# Altium project Mother-daughter.PrjPcb
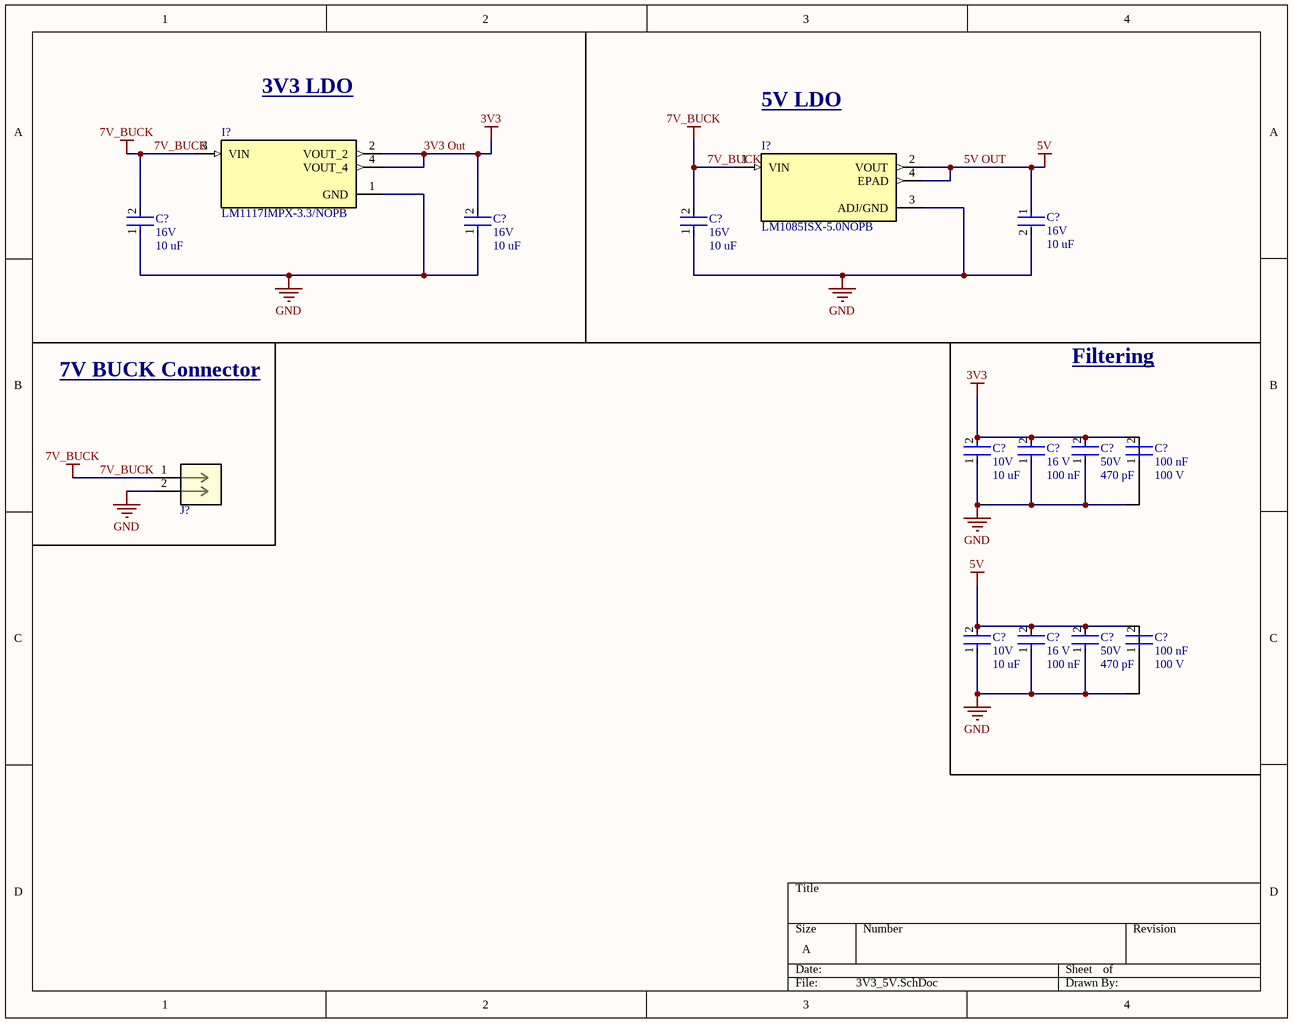
[diagram p0: 3V3_5V.SchDoc]
4 sheets, 69 parts. Net scope: flat (ports and power ports of the same name join across sheets).
Sheets:
  3V3_5V.SchDoc
  CAN.SchDoc
  Connectors.SchDoc
  MCU.SchDoc

## Sheet 3V3_5V.SchDoc
size A; SheetNumber: 1; SheetTotal: 4

### Parts
(Parts that share a designator on the sheet are numbered #1, #2 ... from top to bottom, then left to right.)
C?#1  Voltage: 16V  Capacitance: 10 uF  [CAP-1206]  (hidden comment: 293D106X9016A2TE3)
C?#2  Voltage: 16V  Capacitance: 10 uF  [CAP-1206]  (hidden comment: 293D106X9016A2TE3)
C?#3  Voltage: 16V  Capacitance: 10 uF  [CAP-1206]  (hidden comment: 293D106X9016A2TE3)
C?#4  Voltage: 16V  Capacitance: 10 uF  [CAP-1206]  (hidden comment: 293D106X9016A2TE3)
C?#5  Voltage: 10V  Capacitance: 10 uF  [CAP-0603]  (hidden comment: CC0603KRX5R6BB106)
C?#6  Voltage Rating: 16 V  Capacitance: 100 nF  [CAP-0402]  (hidden comment: CC0402KRX7R7BB104)
C?#7  Voltage: 50V  Capacitance: 470 pF  [CAP-0805]  (hidden comment: CC0805JRNPO9BN471)
C?#8  Capacitance: 100 nF  Voltage: 100 V  [CAP-0603]  (hidden comment: CC0603KRX7R0BB104)
C?#9  Voltage: 10V  Capacitance: 10 uF  [CAP-0603]  (hidden comment: CC0603KRX5R6BB106)
C?#10  Voltage Rating: 16 V  Capacitance: 100 nF  [CAP-0402]  (hidden comment: CC0402KRX7R7BB104)
C?#11  Voltage: 50V  Capacitance: 470 pF  [CAP-0805]  (hidden comment: CC0805JRNPO9BN471)
C?#12  Capacitance: 100 nF  Voltage: 100 V  [CAP-0603]  (hidden comment: CC0603KRX7R0BB104)
I?#1  LM1117IMPX-3.3/NOPB  [IC-SOT-223-4]
I?#2  LM1085ISX-5.0NOPB  [IC-TO-263-4]
J?#1  0430450212  [CON_430450212_MOL]  (value not drawn)

### Nets
3V3 Out: C?#3.2 C?#5.2 C?#6.2 C?#7.2 I?#1.2(VOUT_2) I?#1.4(VOUT_4)  [also labelled 3V3]
5V OUT: C?#1.1 C?#9.2 C?#10.2 C?#11.2 I?#2.2(VOUT) I?#2.4(EPAD)  [also labelled 5V]
7V_BUCK: C?#2.2 C?#4.2 I?#1.3(VIN) I?#2.1(VIN) J?#1.1
GND: C?#1.2 C?#2.1 C?#3.1 C?#4.1 C?#5.1 C?#6.1 C?#7.1 C?#9.1 C?#10.1 C?#11.1 I?#1.1(GND) I?#2.3(ADJ/GND) J?#1.2

Not connected (* = marked no-connect by the designer): C?#8 1 2; C?#12 1 2

### Notes on the sheet
- 3V3 LDO
- 5V LDO
- Filtering
- 7V BUCK Connector

### Library data of the parts
C?#1-C?#4 = CAP-10U-0004: CAP TANT 10UF 10% 16V 1206; Device Class: Tantalum; Size: 1206; ComponentLink1Description: Datasheet; ComponentLink1URL: https://www.lcsc.com/datasheet/lcsc_datasheet_2304140030_Vishay-Intertech-293D106X9016A2TE3_C110038.pdf
C?#5 C?#9 = CAP-10U-0001: CAP CER 10UF 10V X5R 0603; ComponentLink1Description: Datasheet; ComponentLink1URL: https://www.yageo.com/upload/media/product/app/datasheet/mlcc/upy-gphc_x5r_4v-to-50v.pdf; Device Class: Ceramic; Size: 0603
C?#6 C?#10 = CAP-0.1U-0001: CAP CER 0.1UF 16V X7R 0402; ComponentLink2Description: Datasheet; ComponentLink2URL: https://www.yageo.com/upload/media/product/productsearch/datasheet/mlcc/UPY-GPHC_X7R_6.3V-to-250V_24.pdf; Device Class: Ceramic; Size: 0402
C?#7 C?#11 = CAP-470P-0001: CAP CER 470PF 50V C0G/NPO 0805; Device Class: Ceramic; Size: 0805; ComponentLink1Description: Datasheet; ComponentLink1URL: https://www.yageo.com/upload/media/product/productsearch/datasheet/mlcc/UPY-GP_NP0_16V-to-50V_18.pdf
C?#8 C?#12 = CAP-100N-0001: CAP CER 0.1UF 100V X7R 0603; Device Class: Ceramic; Size: 0603; ComponentLink1Description: Datasheet; ComponentLink1URL: https://www.yageo.com/upload/media/product/app/datasheet/mlcc/upy-np0x7r_mv_100-to-630v.pdf
I?#1 = IC_LDO_3V3_0001: IC REG LIN 3.3V 800MA SOT223-4; ComponentLink1Description: New link; ComponentLink1URL: https://www.ti.com/lit/ds/symlink/lm1117.pdf?HQS=dis-dk-null-digikeymode-dsf-pf-null-wwe&ts=1721700739746
I?#2 = IC_LDO_5V_0002: IC REG LIN 5V 3A DDPAK/TO263-3; Mfr_Name: Texas Instruments; RefDes: RefDes; Type: Type; ComponentLink1Description: Datasheet; ComponentLink1URL: https://www.ti.com/lit/ds/symlink/lm1085.pdf?HQS=dis-dk-null-digikeymode-dsf-pf-null-wwe&ts=1729859809163&ref_url=https%253A%252F%252Fwww.ti.com%252Fgeneral%252Fdocs%252Fsuppproductinfo.tsp%253FdistId%253D10%2526gotoUrl%253Dhttps%253A%252F%252Fwww.ti.com%252Flit%252Fgpn%252Flm1085
J?#1 = CONN-2POS-0001: Connector Header Through Hole 2 position; Mfr_Name: Molex Connector Corporation; RefDes: RefDes; Type: Type

## Sheet CAN.SchDoc
size A; SheetNumber: 2; SheetTotal: 4
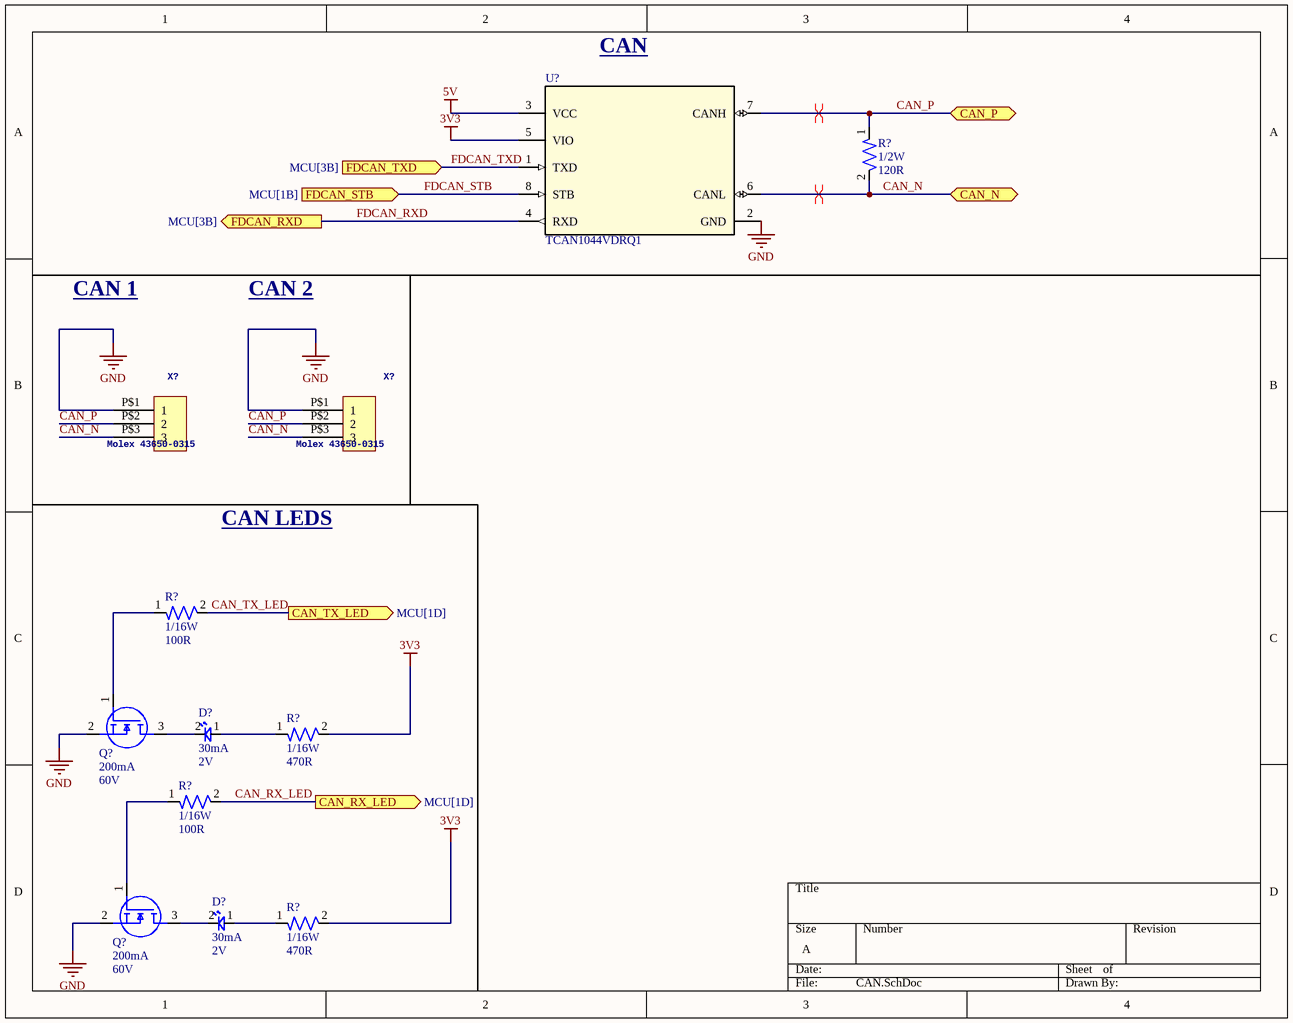
[diagram p1: CAN.SchDoc]

### Parts
(Parts that share a designator on the sheet are numbered #1, #2 ... from top to bottom, then left to right.)
D?#1  Forward Current: 30mA  Forward Voltage: 2V  [LED-0603]  (hidden comment: BL-HKC36G-AV-TRB)
D?#2  Forward Current: 30mA  Forward Voltage: 2V  [LED-0603]  (hidden comment: BL-HKC36G-AV-TRB)
Q?#1  Continuous Current: 200mA  Voltage: 60V  [IC-SOT23-3]  (hidden comment: T2N7002AK,LM)
Q?#2  Continuous Current: 200mA  Voltage: 60V  [IC-SOT23-3]  (hidden comment: T2N7002AK,LM)
R?#1  Power: 1/2W  Resistance: 120R  [RES-1210]  (hidden comment: RC1210FR-07120RL)
R?#2  Power: 1/16W  Resistance: 100R  [RES-0402]  (hidden comment: RC0402FR-07100RL)
R?#3  Power: 1/16W  Resistance: 470R  [RES-0402]  (hidden comment: RC0402FR-07470RL)
R?#4  Power: 1/16W  Resistance: 100R  [RES-0402]  (hidden comment: RC0402FR-07100RL)
R?#5  Power: 1/16W  Resistance: 470R  [RES-0402]  (hidden comment: RC0402FR-07470RL)
U?#1  TCAN1044VDRQ1  [IC-8SOIC]
X?#1  Molex 43650-0315  [43650-0315]
X?#2  Molex 43650-0315  [43650-0315]

### Ports
CAN_N (bidir), CAN_P (bidir), CAN_RX_LED (out, see MCU[1D]), CAN_TX_LED (out, see MCU[1D]), FDCAN_RXD (out, see MCU[3B]), FDCAN_STB (in, see MCU[1B]), FDCAN_TXD (in, see MCU[3B])

### Nets
3V3: R?#3.2 R?#5.2 U?#1.5(VIO)  [project net 3V3 Out]
5V: U?#1.3(VCC)  [project net 5V OUT]
GND: Q?#1.2(S) Q?#2.2(S) U?#1.2(GND) X?#1.P$1(1) X?#2.P$1(1)
CAN_N: R?#1.2 U?#1.6(CANL) X?#1.P$3(3) X?#2.P$3(3) ; port CAN_N
CAN_P: R?#1.1 U?#1.7(CANH) X?#1.P$2(2) X?#2.P$2(2) ; port CAN_P
CAN_RX_LED: R?#4.2 ; port CAN_RX_LED
CAN_TX_LED: R?#2.2 ; port CAN_TX_LED
FDCAN_RXD: U?#1.4(RXD) ; port FDCAN_RXD
FDCAN_STB: U?#1.8(STB) ; port FDCAN_STB
FDCAN_TXD: U?#1.1(TXD) ; port FDCAN_TXD
NetD?#1_1: D?#1.1 R?#3.1
NetD?#1_2: D?#1.2 Q?#1.3(D)
NetD?#2_1: D?#2.1 R?#5.1
NetD?#2_2: D?#2.2 Q?#2.3(D)
NetQ?#1_1: Q?#1.1(G) R?#2.1
NetQ?#2_1: Q?#2.1(G) R?#4.1

### Layout directives
differential pair: CAN_N, CAN_P

### Notes on the sheet
- CAN
- CAN 1
- CAN 2
- CAN LEDS

### Library data of the parts
D?#1 D?#2 = LED-0001: LED YELLOW CLEAR 0603 SMD; ComponentLink1Description: Datasheet; ComponentLink1URL: https://www.americanbrightled.com/pdffiles/led-components/smt/BL-HKC36G-AV-TRB.pdf
Q?#1 Q?#2 = NMOS-200MA-0001: MOSFET N-CH 60V 200MA SOT23; ComponentLink1Description: Datasheet; ComponentLink1URL: https://toshiba.semicon-storage.com/info/T2N7002AK_datasheet_en_20150401.pdf?did=29712&prodName=T2N7002AK
R?#1 = RES-120-0001: RES 120 OHM 1% 1/2W 1210; Tolerance: 1%; Size: 1210; ComponentLink1Description: Datasheet; ComponentLink1URL: https://www.yageo.com/upload/media/product/products/datasheet/rchip/PYu-RC_Group_51_RoHS_L_12.pdf
R?#2 R?#4 = RES-100-0001: RES 100 OHM 1% 1/16W 0402; Tolerance: 1%; Size: 0402; ComponentLink1Description: Datasheet; ComponentLink1URL: https://www.yageo.com/upload/media/product/products/datasheet/rchip/PYu-RC_Group_51_RoHS_L_12.pdf
R?#3 R?#5 = RES-470-0001: RES 470 OHM 1% 1/16W 0402; Tolerance: 1%; Size: 0402; ComponentLink1Description: Datasheet; ComponentLink1URL: https://www.yageo.com/upload/media/product/products/datasheet/rchip/PYu-RC_Group_51_RoHS_L_12.pdf
U?#1 = IC-CAN-0001: IC TRANSCEIVER 1/1 8SOIC; ComponentLink1Description: Datasheet; ComponentLink1URL: https://www.ti.com/lit/ds/symlink/tcan1044-q1.pdf?HQS=dis-dk-null-digikeymode-dsf-pf-null-wwe&ts=1728758303289&ref_url=https%253A%252F%252Fwww.ti.com%252Fgeneral%252Fdocs%252Fsuppproductinfo.tsp%253FdistId%253D10%2526gotoUrl%253Dhttps%253A%252F%252Fwww.ti.com%252Flit%252Fgpn%252Ftcan1044-q1
X?#1 X?#2 = Micro-Fit Molex 3 Pin Vertical: GateName_1: G$1; SymbolName_1: HEADER_POS3; DeviceSetName: HEADER_POS3_?; DeviceName: 43650-0315; LibraryName: con-molex-micro-fit-3_0_2; Package: 43650-0315

## Sheet Connectors.SchDoc
size A; SheetNumber: 3; SheetTotal: 4
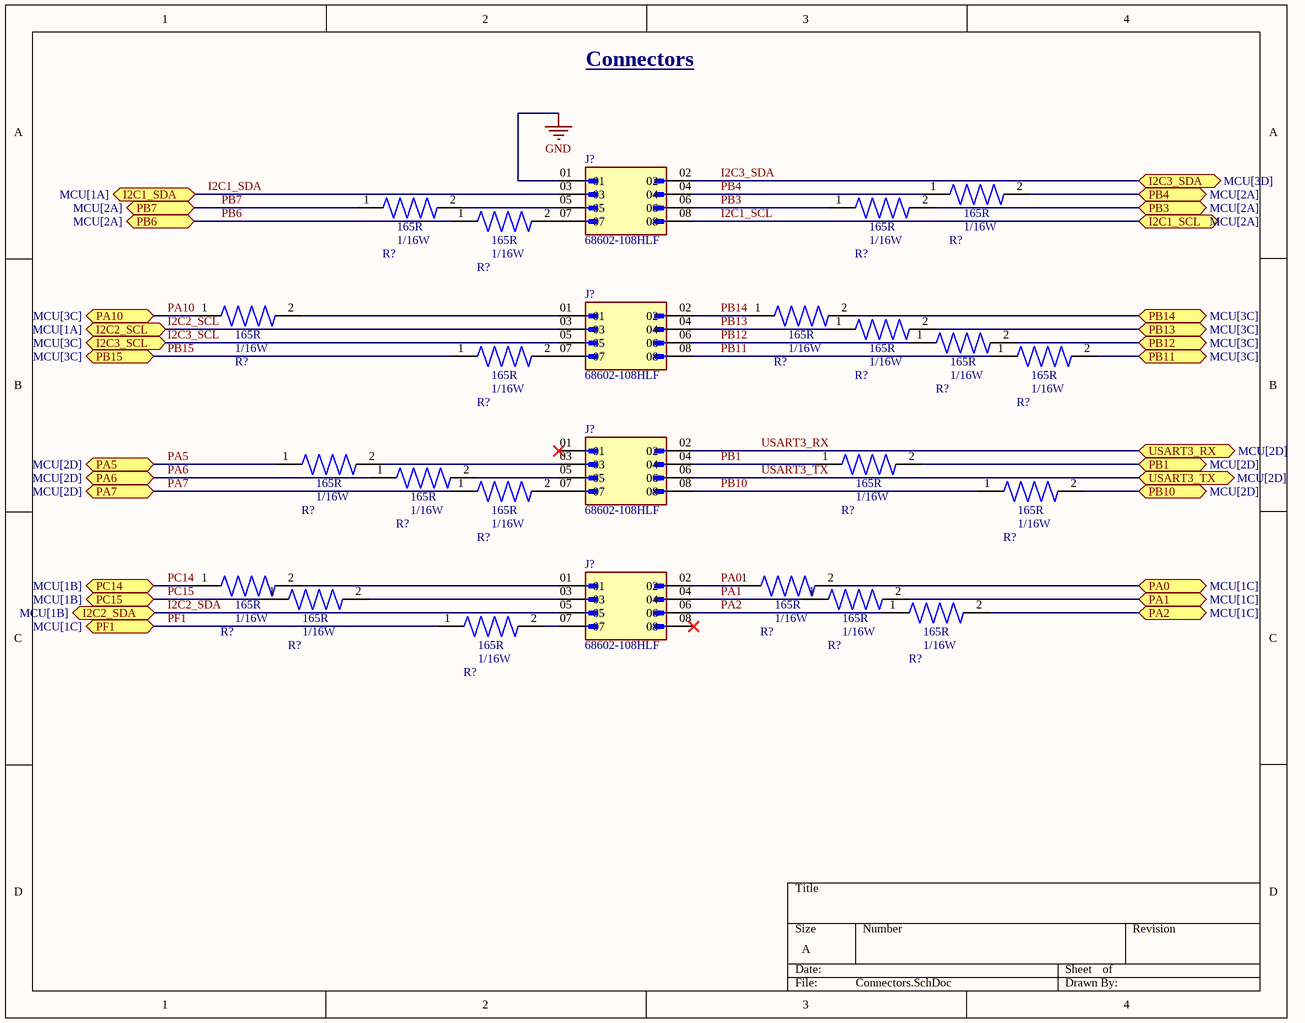
[diagram p2: Connectors.SchDoc]

### Parts
(Parts that share a designator on the sheet are numbered #1, #2 ... from top to bottom, then left to right.)
J?#2  68602-108HLF  [AMPHENOL_68602-108HLF]
J?#3  68602-108HLF  [AMPHENOL_68602-108HLF]
J?#4  68602-108HLF  [AMPHENOL_68602-108HLF]
J?#5  68602-108HLF  [AMPHENOL_68602-108HLF]
R?#6  RC0402FR-07165RL  [RESC1005X40N]  (value not drawn)
R?#7  RC0402FR-07165RL  [RESC1005X40N]  (value not drawn)
R?#8  RC0402FR-07165RL  [RESC1005X40N]  (value not drawn)
R?#9  RC0402FR-07165RL  [RESC1005X40N]  (value not drawn)
R?#10  RC0402FR-07165RL  [RESC1005X40N]  (value not drawn)
R?#11  RC0402FR-07165RL  [RESC1005X40N]  (value not drawn)
R?#12  RC0402FR-07165RL  [RESC1005X40N]  (value not drawn)
R?#13  RC0402FR-07165RL  [RESC1005X40N]  (value not drawn)
R?#14  RC0402FR-07165RL  [RESC1005X40N]  (value not drawn)
R?#15  RC0402FR-07165RL  [RESC1005X40N]  (value not drawn)
R?#16  RC0402FR-07165RL  [RESC1005X40N]  (value not drawn)
R?#17  RC0402FR-07165RL  [RESC1005X40N]  (value not drawn)
R?#18  RC0402FR-07165RL  [RESC1005X40N]  (value not drawn)
R?#19  RC0402FR-07165RL  [RESC1005X40N]  (value not drawn)
R?#20  RC0402FR-07165RL  [RESC1005X40N]  (value not drawn)
R?#21  RC0402FR-07165RL  [RESC1005X40N]  (value not drawn)
R?#22  RC0402FR-07165RL  [RESC1005X40N]  (value not drawn)
R?#23  RC0402FR-07165RL  [RESC1005X40N]  (value not drawn)
R?#24  RC0402FR-07165RL  [RESC1005X40N]  (value not drawn)
R?#25  RC0402FR-07165RL  [RESC1005X40N]  (value not drawn)
R?#26  RC0402FR-07165RL  [RESC1005X40N]  (value not drawn)

### Ports
I2C1_SCL (bidir, see MCU[2A]), I2C1_SDA (bidir, see MCU[1A]), I2C2_SCL (bidir, see MCU[1A]), I2C2_SDA (bidir, see MCU[1B]), I2C3_SCL (bidir, see MCU[3C]), I2C3_SDA (bidir, see MCU[3D]), PA0 (bidir, see MCU[1C]), PA1 (bidir, see MCU[1C]), PA2 (bidir, see MCU[1C]), PA5 (bidir, see MCU[2D]), PA6 (bidir, see MCU[2D]), PA7 (bidir, see MCU[2D]), PA10 (bidir, see MCU[3C]), PB1 (bidir, see MCU[2D]), PB3 (bidir, see MCU[2A]), PB4 (bidir, see MCU[2A]), PB6 (bidir, see MCU[2A]), PB7 (bidir, see MCU[2A]), PB10 (bidir, see MCU[2D]), PB11 (bidir, see MCU[3C]), PB12 (bidir, see MCU[3C]), PB13 (bidir, see MCU[3C]), PB14 (bidir, see MCU[3C]), PB15 (bidir, see MCU[3C]), PC14 (bidir, see MCU[1B]), PC15 (bidir, see MCU[1B]), PF1 (bidir, see MCU[1C]), USART3_RX (bidir, see MCU[2D]), USART3_TX (bidir, see MCU[2D])

### Nets
GND: J?#2.01
I2C1_SCL: J?#2.08 ; port I2C1_SCL
I2C1_SDA: J?#2.03 ; port I2C1_SDA
I2C2_SCL: J?#3.03 ; port I2C2_SCL
I2C2_SDA: J?#5.05 ; port I2C2_SDA
I2C3_SCL: J?#3.05 ; port I2C3_SCL
I2C3_SDA: J?#2.02 ; port I2C3_SDA
PA0: J?#5.02 R?#22.1
PA0: R?#22.2 ; port PA0  [a separate net that carries the same name]
PA1: J?#5.04 R?#24.1
PA1: R?#24.2 ; port PA1  [a separate net that carries the same name]
PA2: J?#5.06 R?#25.1
PA2: R?#25.2 ; port PA2  [a separate net that carries the same name]
PA5: R?#16.1 ; port PA5
PA6: R?#18.1 ; port PA6
PA7: R?#19.1 ; port PA7
PA10: R?#10.1 ; port PA10
PB1: J?#4.04 R?#17.1
PB1: R?#17.2 ; port PB1  [a separate net that carries the same name]
PB3: J?#2.06 R?#8.1
PB3: R?#8.2 ; port PB3  [a separate net that carries the same name]
PB4: J?#2.04 R?#6.1
PB4: R?#6.2 ; port PB4  [a separate net that carries the same name]
PB6: R?#9.1 ; port PB6
PB7: R?#7.1 ; port PB7
PB10: J?#4.08 R?#20.1
PB10: R?#20.2 ; port PB10  [a separate net that carries the same name]
PB11: J?#3.08 R?#15.1
PB11: R?#15.2 ; port PB11  [a separate net that carries the same name]
PB12: J?#3.06 R?#13.1
PB12: R?#13.2 ; port PB12  [a separate net that carries the same name]
PB13: J?#3.04 R?#12.1
PB13: R?#12.2 ; port PB13  [a separate net that carries the same name]
PB14: J?#3.02 R?#11.1
PB14: R?#11.2 ; port PB14  [a separate net that carries the same name]
PB15: R?#14.1 ; port PB15
PC14: R?#21.1 ; port PC14
PC15: R?#23.1 ; port PC15
PF1: R?#26.1 ; port PF1
USART3_RX: J?#4.02 ; port USART3_RX
USART3_TX: J?#4.06 ; port USART3_TX
NetJ?#2_05: J?#2.05 R?#7.2
NetJ?#2_07: J?#2.07 R?#9.2
NetJ?#3_01: J?#3.01 R?#10.2
NetJ?#3_07: J?#3.07 R?#14.2
NetJ?#4_03: J?#4.03 R?#16.2
NetJ?#4_05: J?#4.05 R?#18.2
NetJ?#4_07: J?#4.07 R?#19.2
NetJ?#5_01: J?#5.01 R?#21.2
NetJ?#5_03: J?#5.03 R?#23.2
NetJ?#5_07: J?#5.07 R?#26.2

Not connected (* = marked no-connect by the designer): J?#4 01*; J?#5 08*

### Notes on the sheet
- Connectors
- (in symbol CAP-100U-0001) +

### Library data of the parts
J?#2-J?#5 = CONN-8POS-0002: CONN HEADER VERT 8POS 2.54MM; MF: Amphenol ICC (FCI); SnapEDA_Link: https://www.snapeda.com/parts/68602-108HLF/Amphenol+FCI/view-part/?ref=snap; Package: None; MP: 68602-108HLF; Check_prices: https://www.snapeda.com/parts/68602-108HLF/Amphenol+FCI/view-part/?ref=eda; Price: None; Value: *; Availability: In Stock
R?#6-R?#26 = RES-165-0001: RES 165 OHM 1% 1/16W 0402; Package: None; Price: None; Value: *; MP: RC0402FR-07165RL; Availability: Unavailable

## Sheet MCU.SchDoc
size A; SheetNumber: 4; SheetTotal: 4
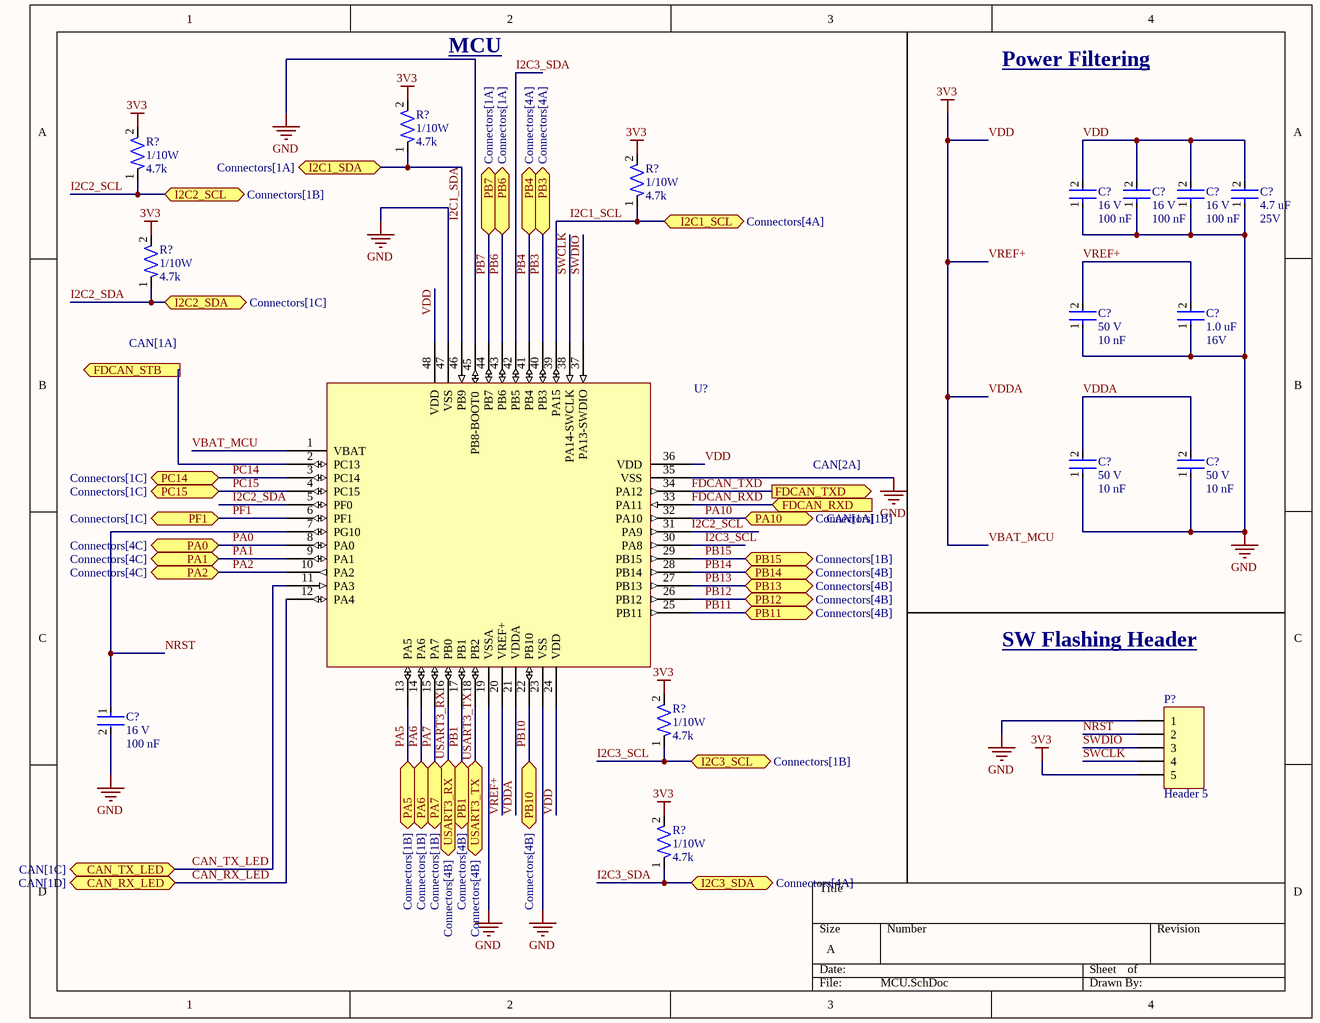
[diagram p3: MCU.SchDoc]

### Parts
(Parts that share a designator on the sheet are numbered #1, #2 ... from top to bottom, then left to right.)
C?#13  Voltage Rating: 16 V  Capacitance: 100 nF  [CAP-0402]  (hidden comment: CC0402KRX7R7BB104)
C?#14  Voltage Rating: 16 V  Capacitance: 100 nF  [CAP-0402]  (hidden comment: CC0402KRX7R7BB104)
C?#15  Voltage Rating: 16 V  Capacitance: 100 nF  [CAP-0402]  (hidden comment: CC0402KRX7R7BB104)
C?#16  Capacitance: 4.7 uF  Voltage: 25V  [CAP-0603]  (hidden comment: CC0603KRX5R8BB475)
C?#17  Voltage: 50 V  Capacitance: 10 nF  [CAP-0603]  (hidden comment: CC0603KPX7R9BB103)
C?#18  Capacitance: 1.0 uF  Voltage: 16V  [CAP-0603]  (hidden comment: CC0603KRX7R7BB105)
C?#19  Voltage: 50 V  Capacitance: 10 nF  [CAP-0603]  (hidden comment: CC0603KPX7R9BB103)
C?#20  Voltage: 50 V  Capacitance: 10 nF  [CAP-0603]  (hidden comment: CC0603KPX7R9BB103)
C?#21  Voltage Rating: 16 V  Capacitance: 100 nF  [CAP-0402]  (hidden comment: CC0402KRX7R7BB104)
P?  Header 5  [HDR1X5]
R?#27  Power: 1/10W  Resistance: 4.7k  [RES-0603]  (hidden comment: RC0603FR-074K7L)
R?#28  Power: 1/10W  Resistance: 4.7k  [RES-0603]  (hidden comment: RC0603FR-074K7L)
R?#29  Power: 1/10W  Resistance: 4.7k  [RES-0603]  (hidden comment: RC0603FR-074K7L)
R?#30  Power: 1/10W  Resistance: 4.7k  [RES-0603]  (hidden comment: RC0603FR-074K7L)
R?#31  Power: 1/10W  Resistance: 4.7k  [RES-0603]  (hidden comment: RC0603FR-074K7L)
R?#32  Power: 1/10W  Resistance: 4.7k  [RES-0603]  (hidden comment: RC0603FR-074K7L)
U?#2  STM32G431CBT6  [IC-LQFP48]  (value not drawn)

### Ports
CAN_RX_LED (bidir, see CAN[1D]), CAN_TX_LED (bidir, see CAN[1C]), FDCAN_RXD (in, see CAN[1A]), FDCAN_STB (out, see CAN[1A]), FDCAN_TXD (out, see CAN[2A]), I2C1_SCL (bidir, see Connectors[4A]), I2C1_SDA (bidir, see Connectors[1A]), I2C2_SCL (bidir, see Connectors[1B]), I2C2_SDA (bidir, see Connectors[1C]), I2C3_SCL (bidir, see Connectors[1B]), I2C3_SDA (bidir, see Connectors[4A]), PA0 (bidir, see Connectors[4C]), PA1 (bidir, see Connectors[4C]), PA2 (bidir, see Connectors[4C]), PA5 (bidir, see Connectors[1B]), PA6 (bidir, see Connectors[1B]), PA7 (bidir, see Connectors[1B]), PA10 (bidir, see Connectors[1B]), PB1 (bidir, see Connectors[4B]), PB3 (bidir, see Connectors[4A]), PB4 (bidir, see Connectors[4A]), PB6 (bidir, see Connectors[1A]), PB7 (bidir, see Connectors[1A]), PB10 (bidir, see Connectors[4B]), PB11 (bidir, see Connectors[4B]), PB12 (bidir, see Connectors[4B]), PB13 (bidir, see Connectors[4B]), PB14 (bidir, see Connectors[4B]), PB15 (bidir, see Connectors[1B]), PC14 (bidir, see Connectors[1C]), PC15 (bidir, see Connectors[1C]), PF1 (bidir, see Connectors[1C]), USART3_RX (bidir, see Connectors[4B]), USART3_TX (bidir, see Connectors[4B])

### Nets
3V3: C?#13.2 C?#14.2 C?#15.2 C?#16.2 C?#17.2 C?#18.2 C?#19.2 C?#20.2 P?.5 R?#27.2 R?#28.2 R?#29.2 R?#30.2 R?#31.2 R?#32.2 U?#2.1(VBAT) U?#2.20(VREF+) U?#2.21(VDDA) U?#2.24(VDD) U?#2.36(VDD) U?#2.48(VDD)  [also labelled VBAT_MCU, VDD, VDDA, VREF+]  [project net 3V3 Out]
GND: C?#13.1 C?#14.1 C?#15.1 C?#16.1 C?#17.1 C?#18.1 C?#19.1 C?#20.1 C?#21.2 P?.1 U?#2.19(VSSA) U?#2.23(VSS) U?#2.35(VSS) U?#2.45(PB8-BOOT0) U?#2.47(VSS)
CAN_RX_LED: U?#2.12(PA4) ; port CAN_RX_LED
CAN_TX_LED: U?#2.11(PA3) ; port CAN_TX_LED
FDCAN_RXD: U?#2.33(PA11) ; port FDCAN_RXD
FDCAN_STB: U?#2.2(PC13) ; port FDCAN_STB
FDCAN_TXD: U?#2.34(PA12) ; port FDCAN_TXD
I2C1_SCL: R?#29.1 U?#2.39(PA15) ; port I2C1_SCL
I2C1_SDA: R?#27.1 U?#2.46(PB9) ; port I2C1_SDA
I2C2_SCL: R?#28.1 U?#2.31(PA9) ; port I2C2_SCL
I2C2_SDA: R?#30.1 U?#2.5(PF0) ; port I2C2_SDA
I2C3_SCL: R?#31.1 U?#2.30(PA8) ; port I2C3_SCL
I2C3_SDA: R?#32.1 U?#2.42(PB5) ; port I2C3_SDA
NRST: C?#21.1 P?.2 U?#2.7(PG10)
PA0: U?#2.8(PA0) ; port PA0
PA1: U?#2.9(PA1) ; port PA1
PA2: U?#2.10(PA2) ; port PA2
PA5: U?#2.13(PA5) ; port PA5
PA6: U?#2.14(PA6) ; port PA6
PA7: U?#2.15(PA7) ; port PA7
PA10: U?#2.32(PA10) ; port PA10
PB1: U?#2.17(PB1) ; port PB1
PB3: U?#2.40(PB3) ; port PB3
PB4: U?#2.41(PB4) ; port PB4
PB6: U?#2.43(PB6) ; port PB6
PB7: U?#2.44(PB7) ; port PB7
PB10: U?#2.22(PB10) ; port PB10
PB11: U?#2.25(PB11) ; port PB11
PB12: U?#2.26(PB12) ; port PB12
PB13: U?#2.27(PB13) ; port PB13
PB14: U?#2.28(PB14) ; port PB14
PB15: U?#2.29(PB15) ; port PB15
PC14: U?#2.3(PC14) ; port PC14
PC15: U?#2.4(PC15) ; port PC15
PF1: U?#2.6(PF1) ; port PF1
SWCLK: P?.4 U?#2.38(PA14-SWCLK)
SWDIO: P?.3 U?#2.37(PA13-SWDIO)
USART3_RX: U?#2.16(PB0) ; port USART3_RX
USART3_TX: U?#2.18(PB2) ; port USART3_TX

### Notes on the sheet
- MCU
- Power Filtering
- SW Flashing Header

### Library data of the parts
C?#13-C?#15 C?#21 = CAP-0.1U-0001: CAP CER 0.1UF 16V X7R 0402; ComponentLink2Description: Datasheet; ComponentLink2URL: https://www.yageo.com/upload/media/product/productsearch/datasheet/mlcc/UPY-GPHC_X7R_6.3V-to-250V_24.pdf; Device Class: Ceramic; Size: 0402
C?#16 = CAP-4.7U-0001: CAP CER 4.7UF 25V X5R 0603; Device Class: Ceramic; Size: 0603
C?#17 C?#19 C?#20 = CAP-10N-0002: CAP CER 10000PF 50V X7R 0603; ComponentLink2Description: Datasheet; ComponentLink2URL: http://www.yageo.com/documents/recent/UPY-GPHC_X7R_6.3V-to-50V_18.pdf; Device Class: Ceramic; Size: 0603
C?#18 = CAP-1U-0002: CAP CER 1UF 16V X7R 0603; Device Class: Ceramic; Size: 0603
P? = Header 5: Header, 5-Pin; LatestRevisionDate: 17-Jul-2002; LatestRevisionNote: Re-released for DXP Platform.; Publisher: Altium Limited
R?#27-R?#32 = RES-4.7k-0001: RES 4.7K OHM 1% 1/10W 0603; Tolerance: 1%; Size: 0603; ComponentLink1Description: Datasheet; ComponentLink1URL: https://www.yageo.com/upload/media/product/products/datasheet/rchip/PYu-RC_Group_51_RoHS_L_12.pdf
U?#2 = IC-STM32G431CBT6: IC MCU 32BIT 128KB FLASH 48LQFP; Package: 48LQFP; ComponentLink1Description: Datasheet; ComponentLink1URL: https://www.st.com/resource/en/datasheet/stm32g431cb.pdf

## Nets that join several sheets
3V3 Out: 3V3_5V (6 pins), CAN (R?#3.2 R?#5.2 U?#1.5), MCU (21 pins)
5V OUT: 3V3_5V (6 pins), CAN (U?#1.3)
GND: 3V3_5V (13 pins), CAN (5 pins), Connectors (J?#2.01), MCU (15 pins)
CAN_RX_LED: CAN (R?#4.2), MCU (U?#2.12)
CAN_TX_LED: CAN (R?#2.2), MCU (U?#2.11)
FDCAN_RXD: CAN (U?#1.4), MCU (U?#2.33)
FDCAN_STB: CAN (U?#1.8), MCU (U?#2.2)
FDCAN_TXD: CAN (U?#1.1), MCU (U?#2.34)
I2C1_SCL: Connectors (J?#2.08), MCU (R?#29.1 U?#2.39)
I2C1_SDA: Connectors (J?#2.03), MCU (R?#27.1 U?#2.46)
I2C2_SCL: Connectors (J?#3.03), MCU (R?#28.1 U?#2.31)
I2C2_SDA: Connectors (J?#5.05), MCU (R?#30.1 U?#2.5)
I2C3_SCL: Connectors (J?#3.05), MCU (R?#31.1 U?#2.30)
I2C3_SDA: Connectors (J?#2.02), MCU (R?#32.1 U?#2.42)
PA0: Connectors (R?#22.2), MCU (U?#2.8)
PA1: Connectors (R?#24.2), MCU (U?#2.9)
PA2: Connectors (R?#25.2), MCU (U?#2.10)
PA5: Connectors (R?#16.1), MCU (U?#2.13)
PA6: Connectors (R?#18.1), MCU (U?#2.14)
PA7: Connectors (R?#19.1), MCU (U?#2.15)
PA10: Connectors (R?#10.1), MCU (U?#2.32)
PB1: Connectors (R?#17.2), MCU (U?#2.17)
PB3: Connectors (R?#8.2), MCU (U?#2.40)
PB4: Connectors (R?#6.2), MCU (U?#2.41)
PB6: Connectors (R?#9.1), MCU (U?#2.43)
PB7: Connectors (R?#7.1), MCU (U?#2.44)
PB10: Connectors (R?#20.2), MCU (U?#2.22)
PB11: Connectors (R?#15.2), MCU (U?#2.25)
PB12: Connectors (R?#13.2), MCU (U?#2.26)
PB13: Connectors (R?#12.2), MCU (U?#2.27)
PB14: Connectors (R?#11.2), MCU (U?#2.28)
PB15: Connectors (R?#14.1), MCU (U?#2.29)
PC14: Connectors (R?#21.1), MCU (U?#2.3)
PC15: Connectors (R?#23.1), MCU (U?#2.4)
PF1: Connectors (R?#26.1), MCU (U?#2.6)
USART3_RX: Connectors (J?#4.02), MCU (U?#2.16)
USART3_TX: Connectors (J?#4.06), MCU (U?#2.18)